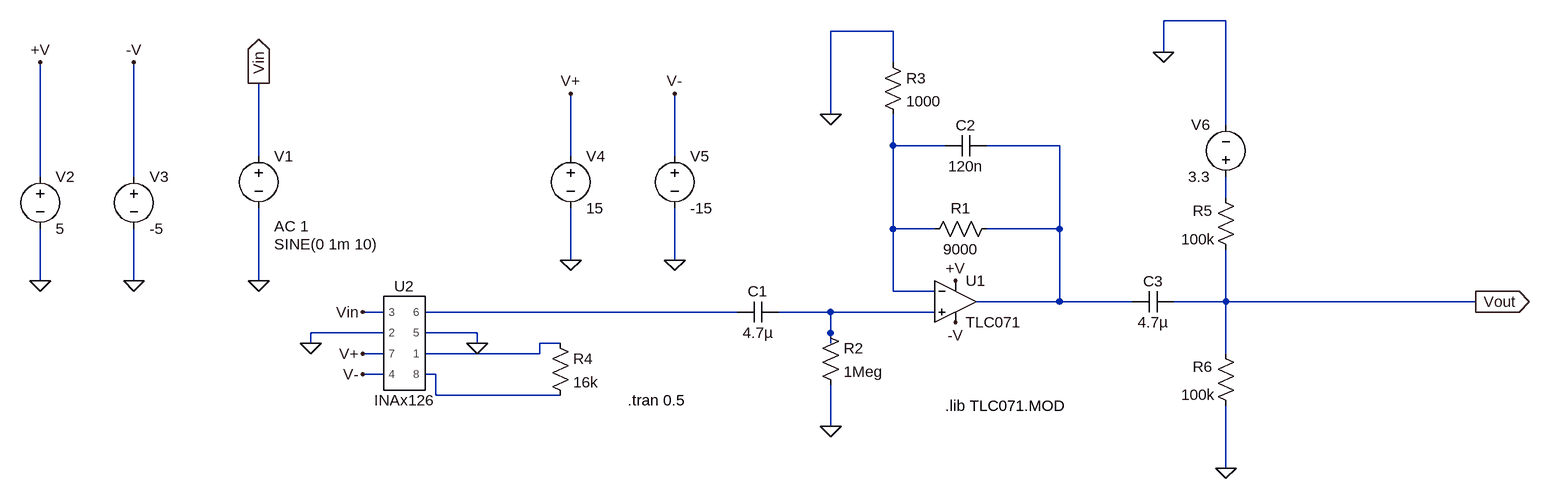
[diagram p0: schematic EKG-prosjekt.asc]
EKG-prosjekt.asc, the LTspice schematic file:
Version 4
SHEET 1 1144 6032
WIRE 592 -272 496 -272
WIRE 80 -256 -16 -256
WIRE 496 -224 496 -272
WIRE 80 -208 80 -256
WIRE -16 -128 -16 -256
WIRE 592 -112 592 -272
WIRE 80 -80 80 -128
WIRE 160 -80 80 -80
WIRE 336 -80 224 -80
WIRE -896 -64 -896 -176
WIRE -416 -64 -416 -160
WIRE -256 -64 -256 -160
WIRE -1232 -32 -1232 -208
WIRE -1088 -32 -1088 -208
WIRE 592 0 592 -32
WIRE 80 48 80 -80
WIRE 144 48 80 48
WIRE 336 48 336 -80
WIRE 336 48 224 48
WIRE -416 96 -416 16
WIRE -256 96 -256 16
WIRE -1232 128 -1232 48
WIRE -1088 128 -1088 48
WIRE -896 128 -896 16
WIRE 80 144 80 48
WIRE 144 144 80 144
WIRE 336 160 336 48
WIRE 336 160 208 160
WIRE 448 160 336 160
WIRE 592 160 592 80
WIRE 592 160 512 160
WIRE 976 160 592 160
WIRE -704 176 -736 176
WIRE -160 176 -640 176
WIRE -16 176 -96 176
WIRE 144 176 -16 176
WIRE -704 208 -816 208
WIRE -560 208 -640 208
WIRE -16 208 -16 176
WIRE -816 224 -816 208
WIRE -560 224 -560 208
WIRE -432 224 -464 224
WIRE -16 224 -16 208
WIRE -704 240 -736 240
WIRE -464 240 -464 224
WIRE -464 240 -640 240
WIRE 592 240 592 160
WIRE -704 272 -736 272
WIRE -624 272 -640 272
WIRE -624 304 -624 272
WIRE -432 304 -624 304
WIRE -16 352 -16 288
WIRE 592 416 592 320
FLAG -16 352 0
FLAG -896 128 0
FLAG -896 -176 Vin
IOPIN -896 -176 Out
FLAG 976 160 Vout
IOPIN 976 160 Out
FLAG -1232 128 0
FLAG -1088 128 0
FLAG -1232 -208 +V
FLAG -1088 -208 -V
FLAG 176 192 -V
FLAG 176 128 +V
FLAG -16 -128 0
FLAG -256 96 0
FLAG -416 96 0
FLAG -560 224 0
FLAG -736 176 Vin
FLAG -816 224 0
FLAG -416 -160 V+
FLAG -736 240 V+
FLAG -256 -160 V-
FLAG -736 272 V-
FLAG 592 416 0
FLAG 496 -224 0
SYMBOL res 240 32 R90
WINDOW 0 0 56 VBottom 2
WINDOW 3 32 56 VTop 2
SYMATTR InstName R1
SYMATTR Value 9000
SYMBOL voltage -896 -80 R0
WINDOW 123 24 124 Left 2
WINDOW 39 0 0 Left 0
WINDOW 3 24 152 Left 2
SYMATTR Value2 AC 1
SYMATTR Value SINE(0 1m 10)
SYMATTR InstName V1
SYMBOL voltage -1232 -48 R0
WINDOW 123 0 0 Left 0
WINDOW 39 0 0 Left 0
SYMATTR InstName V2
SYMATTR Value 5
SYMBOL voltage -1088 -48 R0
WINDOW 123 0 0 Left 0
WINDOW 39 0 0 Left 0
SYMATTR InstName V3
SYMATTR Value -5
SYMBOL cap 224 -96 R90
WINDOW 0 0 32 VBottom 2
WINDOW 3 32 32 VTop 2
SYMATTR InstName C2
SYMATTR Value 120n
SYMBOL cap -96 160 R90
WINDOW 0 0 32 VBottom 2
WINDOW 3 32 32 VTop 2
SYMATTR InstName C1
SYMATTR Value 4.7µ
SYMBOL res -32 192 R0
SYMATTR InstName R2
SYMATTR Value 1Meg
SYMBOL res 64 -224 R0
SYMATTR InstName R3
SYMATTR Value 1000
SYMBOL OpAmps\\opamp2 176 96 R0
SYMATTR InstName U1
SYMATTR Value TLC071
SYMBOL AutoGenerated\\INAx126 -672 224 R0
SYMATTR InstName U2
SYMBOL res -448 208 R0
SYMATTR InstName R4
SYMATTR Value 16k
SYMBOL voltage -416 -80 R0
WINDOW 123 0 0 Left 0
WINDOW 39 0 0 Left 0
SYMATTR InstName V4
SYMATTR Value 15
SYMBOL voltage -256 -80 R0
WINDOW 123 0 0 Left 0
WINDOW 39 0 0 Left 0
SYMATTR InstName V5
SYMATTR Value -15
SYMBOL cap 512 144 R90
WINDOW 0 0 32 VBottom 2
WINDOW 3 32 32 VTop 2
SYMATTR InstName C3
SYMATTR Value 4.7µ
SYMBOL res 608 96 R180
WINDOW 0 36 76 Left 2
WINDOW 3 32 32 Left 2
SYMATTR InstName R5
SYMATTR Value 100k
SYMBOL res 608 336 R180
WINDOW 0 36 76 Left 2
WINDOW 3 32 33 Left 2
SYMATTR InstName R6
SYMATTR Value 100k
SYMBOL voltage 592 -16 R180
WINDOW 0 24 96 Left 2
WINDOW 3 24 16 Left 2
WINDOW 123 0 0 Left 0
WINDOW 39 0 0 Left 0
SYMATTR InstName V6
SYMATTR Value 3.3
TEXT -328 312 Left 2 !.tran 0.5
TEXT 160 320 Left 2 !.lib TLC071.MOD

The netlist it stands for:
* EKG-prosjekt.asc
R1 N002 N001 9000
V1 Vin 0 SINE(0 1m 10) AC 1
V2 +V 0 5
V3 -V 0 -5
C2 N002 N001 120n
C1 N005 N004 4.7µ
R2 N005 0 1Meg
R3 0 N001 1000
XU1 N005 N001 +V -V N002 TLC071  ; pins In+ In- V+ V- OUT
XU2 Vin 0 V+ V- N004 0 N006 N007 INAx126  ; pins 3 2 7 4 6 5 1 8
R4 N006 N007 16k
V4 V+ 0 15
V5 V- 0 -15
C3 Vout N002 4.7µ
R5 Vout N003 100k
R6 0 Vout 100k
V6 N003 0 3.3
.tran 0.5
.lib TLC071.MOD
.lib INAx126.LIB
.backanno
.end